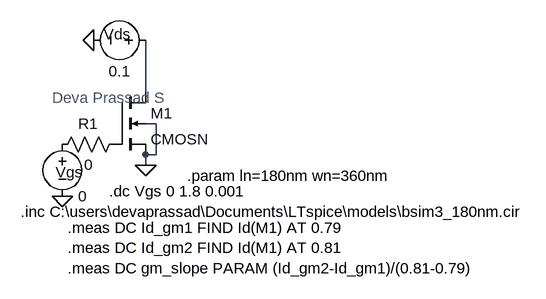
[diagram p0: schematic gm.asc]
gm.asc, the LTspice schematic file:
Version 4.1
SHEET 1 880 680
WIRE 160 96 160 16
WIRE 176 144 160 144
WIRE 176 192 176 144
WIRE 176 192 160 192
WIRE 160 208 160 192
FLAG 160 208 0
FLAG 80 16 0
FLAG 32 256 0
SYMBOL nmos4 112 96 R0
SYMATTR InstName M1
SYMATTR Value2 l={ln} w={wn} ad={ln*wn} as={ln*wn} pd={2*ln+wn} ps={2*ln+wn}
SYMATTR Value CMOSN
SYMBOL voltage 32 160 R0
WINDOW 0 -10 59 Left 2
WINDOW 123 0 0 Left 0
WINDOW 39 0 0 Left 0
SYMATTR InstName Vgs
SYMATTR Value 0
SYMBOL voltage 176 16 R90
WINDOW 0 6 60 VBottom 2
WINDOW 3 32 56 VTop 2
WINDOW 123 0 0 Left 0
WINDOW 39 0 0 Left 0
SYMATTR InstName Vds
SYMATTR Value 0.1
SYMBOL res 128 160 R90
WINDOW 0 0 56 VBottom 2
WINDOW 3 32 56 VTop 2
SYMATTR InstName R1
SYMATTR Value 0
TEXT 104 248 Left 2 !.dc Vgs 0 1.8 0.001
TEXT -32 280 Left 2 !.inc C:\\users\\devaprassad\\Documents\\LTspice\\models\\bsim3_180nm.cir
TEXT 224 224 Left 2 !.param ln=180nm wn=360nm
TEXT 40 304 Left 2 !.meas DC Id_gm1 FIND Id(M1) AT 0.79\n.meas DC Id_gm2 FIND Id(M1) AT 0.81\n.meas DC gm_slope PARAM (Id_gm2-Id_gm1)/(0.81-0.79)
TEXT 16 104 Left 2 ;Deva Prassad S

The netlist it stands for:
* gm.asc
M1 N001 P001 0 0 CMOSN l={ln} w={wn} ad={ln*wn} as={ln*wn} pd={2*ln+wn} ps={2*ln+wn}
Vgs P002 0 0
Vds N001 0 0.1
R1 P001 P002 0
.model NMOS NMOS
.model PMOS PMOS
.lib standard.mos
.dc Vgs 0 1.8 0.001
.inc C:\users\devaprassad\Documents\LTspice\models\bsim3_180nm.cir
.param ln=180nm wn=360nm
.meas DC Id_gm1 FIND Id(M1) AT 0.79
.meas DC Id_gm2 FIND Id(M1) AT 0.81
.meas DC gm_slope PARAM (Id_gm2-Id_gm1)/(0.81-0.79)
* Deva Prassad S
.backanno
.end